# Altium schematic sheet Regulator_Sheet.SchDoc
size A4; DocumentNumber: 3; SheetNumber: 3; SheetTotal: 4
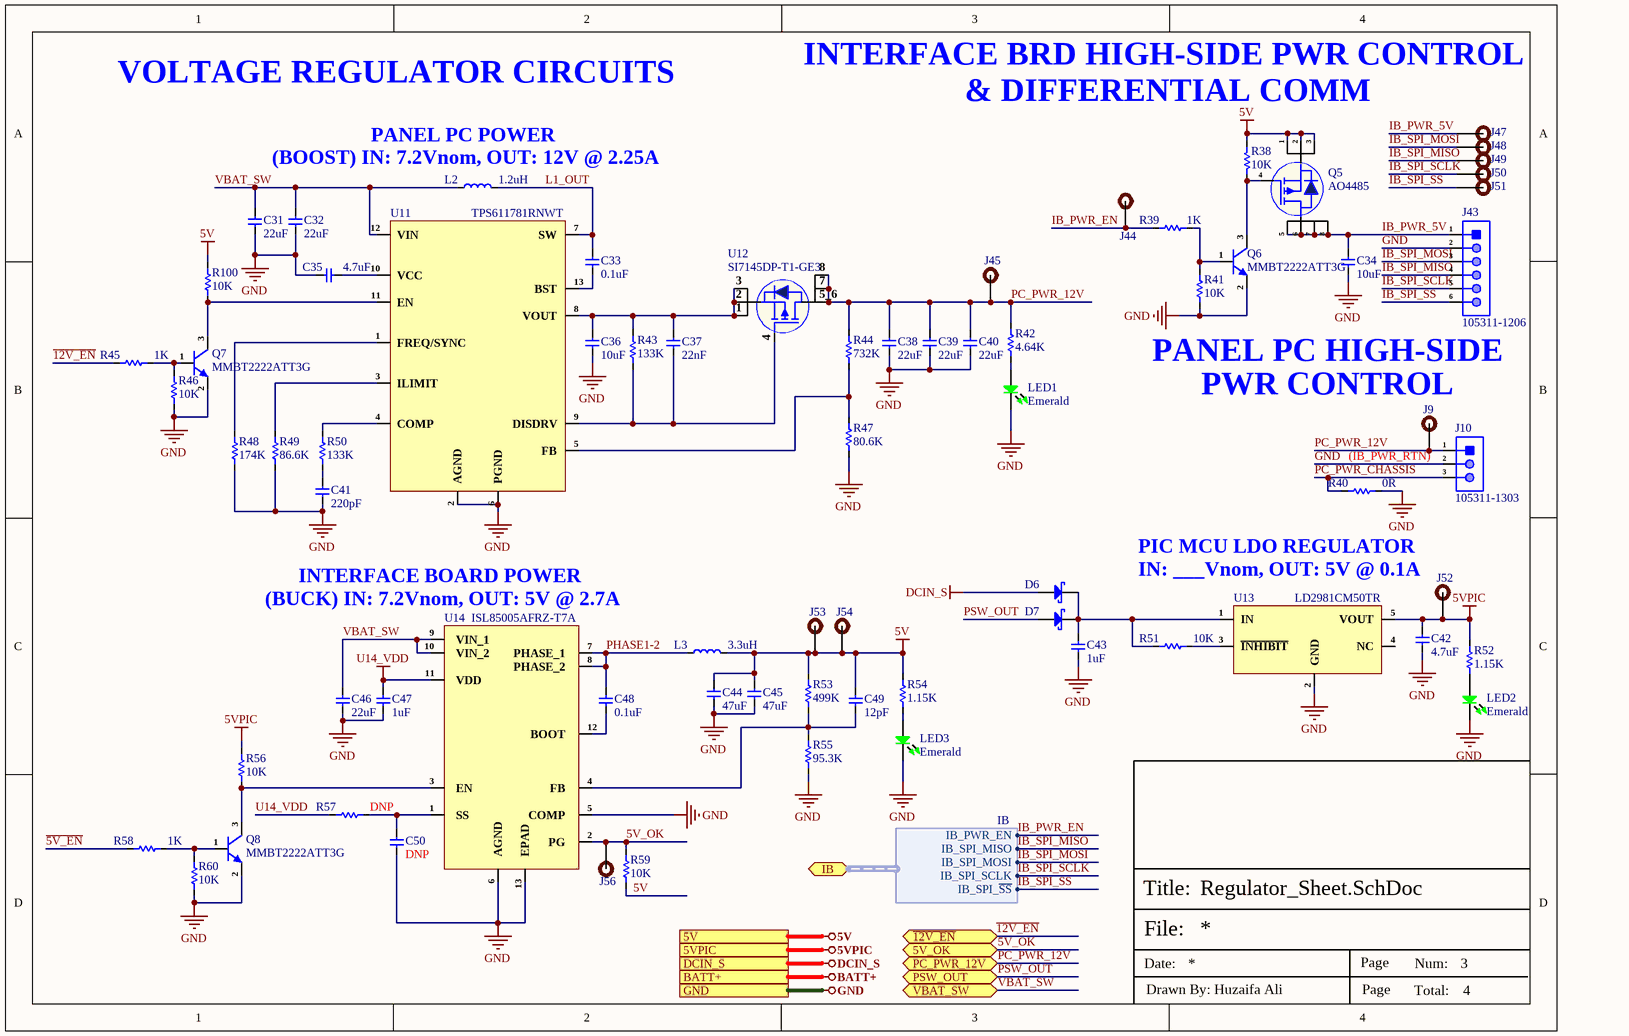
[diagram p0: Regulator_Sheet.SchDoc]

## Parts
C31  22uF  [Cap-1206]
C32  22uF  [Cap-1206]
C33  0.1uF  [Cap-0603]
C34  10uF  [Cap-0603]
C35  4.7uF  [Cap-0603]
C36  10uF  [Cap-1206]
C37  22nF  [Cap-0603]
C38  22uF  [Cap-1206]
C39  22uF  [Cap-1206]
C40  22uF  [Cap-1206]
C41  220pF  [Cap-0603]
C42  4.7uF  [Cap-0603]
C43  1uF  [Cap-0603]
C44  47uF  [SMD 2 J_Lead]
C45  47uF  [SMD 2 J_Lead]
C46  22uF  [Cap-1206]
C47  1uF  [Cap-0603]
C48  0.1uF  [Cap-0402]
C49  12pF  [Cap-0402]
C50  DNP  [Cap-0402]
D6  1SS404,H3F  [USC]  (value not drawn)
D7  1SS404,H3F  [USC]  (value not drawn)
J9  Test Point -TH 1.8mm Hole size 0.92mm  [Test Point -TH 1.8mm Hole size 0.92mm]  (value not drawn)  (no BOM)
J10  105311-1303  [1053111303]
J43  105311-1206  [1053111206]
J44  Test Point -TH 1.8mm Hole size 0.92mm  [Test Point -TH 1.8mm Hole size 0.92mm]  (value not drawn)  (no BOM)
J45  Test Point -TH 1.8mm Hole size 0.92mm  [Test Point -TH 1.8mm Hole size 0.92mm]  (value not drawn)  (no BOM)
J47  Test Point -TH 1.8mm Hole size 0.92mm  [Test Point -TH 1.8mm Hole size 0.92mm]  (value not drawn)  (no BOM)
J48  Test Point -TH 1.8mm Hole size 0.92mm  [Test Point -TH 1.8mm Hole size 0.92mm]  (value not drawn)  (no BOM)
J49  Test Point -TH 1.8mm Hole size 0.92mm  [Test Point -TH 1.8mm Hole size 0.92mm]  (value not drawn)  (no BOM)
J50  Test Point -TH 1.8mm Hole size 0.92mm  [Test Point -TH 1.8mm Hole size 0.92mm]  (value not drawn)  (no BOM)
J51  Test Point -TH 1.8mm Hole size 0.92mm  [Test Point -TH 1.8mm Hole size 0.92mm]  (value not drawn)  (no BOM)
J52  Test Point -TH 1.8mm Hole size 0.92mm  [Test Point -TH 1.8mm Hole size 0.92mm]  (value not drawn)  (no BOM)
J53  Test Point -TH 1.8mm Hole size 0.92mm  [Test Point -TH 1.8mm Hole size 0.92mm]  (value not drawn)  (no BOM)
J54  Test Point -TH 1.8mm Hole size 0.92mm  [Test Point -TH 1.8mm Hole size 0.92mm]  (value not drawn)  (no BOM)
J56  Test Point -TH 1.8mm Hole size 0.92mm  [Test Point -TH 1.8mm Hole size 0.92mm]  (value not drawn)  (no BOM)
L2  1.2uH  [XAL5030-122MEC]
L3  3.3uH  [DRA74-3R3-R]
LED1  Emerald  [LED-0603]
LED2  Emerald  [LED-0603]
LED3  Emerald  [LED-0603]
Q5  AO4485  [SOIC-8]
Q6  MMBT2222ATT3G  [MMBT2222ATT3G]
Q7  MMBT2222ATT3G  [MMBT2222ATT3G]
Q8  MMBT2222ATT3G  [MMBT2222ATT3G]
R38  10K  [Res-0603]
R39  1K  [Res-0603]
R40  0R  [Res-0805]
R41  10K  [Res-0603]
R42  4.64K  [Res-1206]
R43  133K  [Res-0402]
R44  732K  [Res-0402]
R45  1K  [Res-0603]
R46  10K  [Res-0603]
R47  80.6K  [Res-0402]
R48  174K  [Res-0402]
R49  86.6K  [Res-0402]
R50  133K  [Res-0402]
R51  10K  [Res-0603]
R52  1.15K  [Res-0402]
R53  499K  [Res-0402]
R54  1.15K  [Res-0402]
R55  95.3K  [Res-0402]
R56  10K  [Res-0603]
R57  DNP  [Res-0402]
R58  1K  [Res-0603]
R59  10K  [Res-0603]
R60  10K  [Res-0603]
R100  10K  [Res-0603]
U11  TPS611781RNWT  [VQFN-13-HR(3x3.5)]
U12  SI7145DP-T1-GE3  [PowerPAK-SO-8]
U13  LD2981CM50TR  [SOT-23-5]
U14  ISL85005AFRZ-T7A  [12-DFN (4x3)]

## Ports
5V (see Controller_Sheet[4A]), 5V_OK (bidir, see Controller_Sheet[4A]), 5VPIC (see Controller_Sheet[4A]), BATT+ (see Power_Sheet[3D]), DCIN_S (see Controller_Sheet[4A], Power_Sheet[3D]), GND (see Controller_Sheet[4A], Power_Sheet[3D]), IB (bidir, harness IB, see Controller_Sheet[4B]), PC_PWR_12V (bidir, see Controller_Sheet[4A]), PSW_OUT (bidir, see Controller_Sheet[4A], Power_Sheet[2D]), VBAT_SW (bidir, see Power_Sheet[2D]), ~{12V_EN} (bidir, see Controller_Sheet[4A])

## Harnesses
IB: IB_PWR_EN, IB_SPI_MISO, IB_SPI_MOSI, IB_SPI_SCLK, IB_SPI_~{SS}

## Nets
5V: C44.2 C45.2 C49.2 J53.1 J54.1 L3.2 Q5.1(S) Q5.2(S) Q5.3(S) R38.2 R53.2 R54.2 R59.2 R100.1 ; port 5V
5VPIC: C42.2 J52.1 R52.2 R56.1 U13.5(VOUT) ; port 5VPIC
BATT+: port BATT+
DCIN_S: D6.2(A) ; port DCIN_S
GND: C31.1 C32.1 C34.1 C35.1 C36.1 C38.1 C39.1 C40.1 C41.1 C42.1 C43.1 C44.1 C45.1 C46.1 C47.1 C50.1 J10.2 J43.2 LED1.2 LED2.2 LED3.2 Q6.2(E) Q7.2(E) Q8.2(E) R40.1 R41.2 R46.2 R47.1 R48.1 R49.1 R55.2 R60.2 U11.2(AGND) U11.6(PGND) U13.2(GND) U14.5(COMP) U14.6(AGND) U14.13(EPAD) ; port GND
U14_VDD: C47.2 R57.1 U14.11(VDD)
~{12V_EN}: R45.1
~{5V_EN}: R58.1
5V_OK: J56.1 R59.1 U14.2(PG) ; port 5V_OK
IB_PWR_5V: C34.2 J43.1 J47.1 Q5.5(D) Q5.6(D) Q5.7(D) Q5.8(D)
IB_PWR_EN: J44.1 R39.1 ; port IB.IB_PWR_EN
IB_SPI_MISO: J43.4 J49.1 ; port IB.IB_SPI_MISO
IB_SPI_MOSI: J43.3 J48.1 ; port IB.IB_SPI_MOSI
IB_SPI_~{SS}: J43.6 J51.1 ; port IB.IB_SPI_~{SS}
IB_SPI_SCLK: J43.5 J50.1 ; port IB.IB_SPI_SCLK
L1_OUT: C33.2 L2.2 U11.7(SW)
PC_PWR_12V: C38.2 C39.2 C40.2 J9.1 J10.1 J45.1 R42.2 R44.2 U12.5_6(D) U12.7(D) U12.8(D) ; port PC_PWR_12V
PC_PWR_CHASSIS: J10.3 R40.2
PHASE1-2: C48.2 L3.1 U14.7(PHASE_1) U14.8(PHASE_2)
PSW_OUT: D7.2(A) ; port PSW_OUT
VBAT_SW: C31.2 C32.2 C46.2 L2.1 U11.12(VIN) U14.9(VIN_1) U14.10(VIN_2) ; port VBAT_SW
NetC33_1: C33.1 U11.13(BST)
NetC35_2: C35.2 U11.10(VCC)
NetC36_2: C36.2 C37.2 R43.2 U11.8(VOUT) U12.1(S) U12.2(S) U12.3(S)
NetC37_1: C37.1 R43.1 U11.9(DISDRV) U12.4(G)
NetC41_2: C41.2 R50.1
NetC43_2: C43.2 D6.1(K) D7.1(K) R51.1 U13.1(IN)
NetC48_1: C48.1 U14.12(BOOT)
NetC49_1: C49.1 R53.1 R55.1 U14.4(FB)
NetC50_2: C50.2 R57.2 U14.1(SS)
NetLED1_1: LED1.1 R42.1
NetLED2_1: LED2.1 R52.1
NetLED3_1: LED3.1 R54.1
NetQ5_4: Q5.4(G) Q6.3(C) R38.1
NetQ6_1: Q6.1(B) R39.2 R41.1
NetQ7_1: Q7.1(B) R45.2 R46.1
NetQ7_3: Q7.3(C) R100.2 U11.11(EN)
NetQ8_1: Q8.1(B) R58.2 R60.1
NetQ8_3: Q8.3(C) R56.2 U14.3(EN)
NetR44_1: R44.1 R47.2 U11.5(FB)
NetR48_2: R48.2 U11.1(FREQ/SYNC)
NetR49_2: R49.2 U11.3(ILIMIT)
NetR50_2: R50.2 U11.4(COMP)
NetR51_2: R51.2 U13.3(~{INHIBIT})

Not connected (* = marked no-connect by the designer): U13 4(NC)

## Notes on the sheet
- VOLTAGE REGULATOR CIRCUITS
- INTERFACE BRD HIGH-SIDE PWR CONTROL
  & DIFFERENTIAL COMM
- (near L2) PANEL PC POWER
  (BOOST) IN: 7.2Vnom, OUT: 12V @ 2.25A
- PANEL PC HIGH-SIDE
- (near J9) PWR CONTROL
- (IB_PWR_RTN)
- PIC MCU LDO REGULATOR
  IN: ___Vnom, OUT: 5V @ 0.1A
- INTERFACE BOARD POWER
  (BUCK) IN: 7.2Vnom, OUT: 5V @ 2.7A
- Labels drawn without touching a wire or pin: ~{12V_EN}
- File:
- Title:
- Date:
- Page
- Num:
- Total:
- Drawn By: Huzaifa Ali

## Library data of the parts
C31 C32 C38-C40 C46 = C3216X5R1E226MTJ00N: Multilayer Ceramic Capacitor, 22 uF, 25 V, ± 20%, X5R, 1206 [3216 Metric]; Manufacturer: TDK; Manufacturer Part Number: C3216X5R1E226M160AB; Material: 4241ConductorMaterial; Voltage Rating: 25V; Supplier: Digikey; Supplier Part Number: 445-6000-1-ND; RoHS: Yes; Category: Ceramic Capacitors; Stock: 21443; Pricing: 1=0.8, 10=0.557, 50=0.4692, 100=0.3821, 500=0.3184, 1000=0.26813 (USD); Mounting Technology: Surface Mount; Case/Package: 1206; Case Code (Metric): 3216; Case Code (Imperial): 1206; Weight: 0.000571oz; Dielectric Material: 4241ConductorMaterial; Min Operating Temperature: -55°C; Max Operating Temperature: 85°C; Package Quantity: 1; Value: 22uF; Tolerance: 20%; Packaging: Tape and Reel; Voltage Rating (DC): 25V; Dielectric: X5R; Termination: SMD/SMT; Series: C; Construction: Flat; Length: 3.2mm; Width: 0.063inch; Height: 1.6mm; Thickness: 0.071inch; Depth: 1.6mm; RoHS Compliant: Yes; Reach SVHC Compliant: Unknown; Lead Free: 5697LeadFree; ComponentLink1URL: https://datasheet.ciiva.com/24216/c3216x5r1e226m160ab-265194-24216564.pdf?src-supplier=Mouser; ComponentLink1Description: https://datasheet.ciiva.com/24216/c3216x5r1e226m160ab-265194-24216564.pdf?src-supplier=Mouser; ComponentLink2URL: https://datasheet.ciiva.com/6285/tdkmlcccaprange-6285575.pdf?src-supplier=Digikey; ComponentLink2Description: https://datasheet.ciiva.com/6285/tdkmlcccaprange-6285575.pdf?src-supplier=Digikey; ComponentLink3URL: https://datasheet.ciiva.com/6285/tdkmlcccaprange-6285573.pdf?src-supplier=Digikey; ComponentLink3Description: https://datasheet.ciiva.com/6285/tdkmlcccaprange-6285573.pdf?src-supplier=Digikey
C33 = CL10B104KB8NNNC: CAP CER 0.1UF 50V X7R 0603; Manufacturer: Samsung; Material: Ceramic; Capacitance: 100nF; Tolerance: 10%; Supplier 1: Digi-Key; Manufacturer Part Number: CL10B104KB8NNNC; RoHS: Yes; Category: Ceramic Capacitors; Stock 1: 3998791; Pricing 1: 1=0.10000, 10=0.03000, 50=0.01640, 100=0.01340, 500=0.00954, 1000=0.00750 (USD); Mount: Surface Mount; Case/Package: 0603; Case Code (Metric): 1608; Case Code (Imperial): 0603; Contact Plating: Tin; Min Operating Temperature: -55°C; Max Operating Temperature: 125°C; Dielectric: X7R; Voltage Rating: 50V; Package Quantity: 1; Packaging: Tape and Reel; Voltage: 50V; Voltage Rating (DC): 50V; Series: CL; Construction: Flat; Length: 1.6mm; Width: 0.031inch; Height: 0.8mm; Depth: 0.8mm; Thickness: 0.035inch; Radiation Hardening: No; Lead Free: Lead Free; RoHS Compliant: Yes; ComponentLink1URL: https://datasheet.ciiva.com/25803/cl10b104kb8nnnc-25803393.pdf?src-supplier=Digi-Key; ComponentLink1Description: https://datasheet.ciiva.com/25803/cl10b104kb8nnnc-25803393.pdf?src-supplier=Digi-Key; ComponentLink2URL: https://datasheet.ciiva.com/26838/getdatasheetpartid-89097-26838411.pdf?src-supplier=Verical; ComponentLink2Description: https://datasheet.ciiva.com/26838/getdatasheetpartid-89097-26838411.pdf?src-supplier=Verical; ComponentLink3URL: https://datasheet.ciiva.com/29198/456651-da-01-en-vs-kondensator-0605-29198839.pdf?src-supplier=Conrad; ComponentLink3Description: https://datasheet.ciiva.com/29198/456651-da-01-en-vs-kondensator-0605-29198839.pdf?src-supplier=Conrad; Supplier Part Number 1: 1276-1000-1-ND; LCSC Part Number: C1591
C34 = CC0603KRX5R6BB106: CAP CER 10UF 10V X5R 0603; Manufacturer: Yageo; Tolerance: 10%; Item Type: Capacitor; Supplier 1: Digi-Key; Manufacturer Part Number: CC0603KRX5R6BB106; RoHS: Yes; Category: Ceramic Capacitors; Stock 1: 187515; Pricing 1: 1=0.24000, 10=0.16300, 50=0.09780, 100=0.08260, 500=0.05654, 1000=0.05001 (USD); Mount: Surface Mount; Case/Package: 0603; Case Code (Metric): 1608; Case Code (Imperial): 0603; Weight: 7.1E-05oz; Min Operating Temperature: -55°C; Max Operating Temperature: 85°C; Capacitance: 10uF; Packaging: Tape and Reel; Dielectric: X5R; Voltage Rating: 10V; Termination: SMD/SMT; Resistor Type: Ceramic; Voltage Rating (DC): 10V; Package Quantity: 4000; Length: 0.063inch; Width: 0.031inch; Thickness: 0.035inch; Depth: 0.8mm; Lead Free: Lead Free; Halogen Free: Halogen Free; RoHS Compliant: Yes; ComponentLink1URL: http://www.mouser.com/ds/2/447/Yageo_UPY-GP_NP0_16V-to-50V_9-358835.pdf?src-supplier=Mouser; ComponentLink1Description: http://www.mouser.com/ds/2/447/Yageo_UPY-GP_NP0_16V-to-50V_9-358835.pdf?src-supplier=Mouser; ComponentLink2URL: http://www.yageo.com/documents/recent/UPY-GPHC_X5R_4V-to-50V_25.pdf?src-supplier=Digi-Key; ComponentLink2Description: http://www.yageo.com/documents/recent/UPY-GPHC_X5R_4V-to-50V_25.pdf?src-supplier=Digi-Key; Supplier Part Number 1: 311-1782-1-ND; LCSC Part Number: C326057
C35 C42 = CC0603KRX5R7BB475: CAP CER 4.7UF 16V X5R 0603; Manufacturer: Yageo; Tolerance: 10%; Item Type: Capacitor; Supplier 1: Digi-Key; Manufacturer Part Number: CC0603KRX5R7BB475; RoHS: Yes; Category: Ceramic Capacitors; Stock 1: 547703; Pricing 1: 1=0.20000, 10=0.13800, 50=0.08280, 100=0.06990, 500=0.04784, 1000=0.04233 (USD); Mount: Surface Mount; Case/Package: 0603; Case Code (Imperial): 0603; Case Code (Metric): 1608; Weight: 7.1E-05oz; Min Operating Temperature: -55°C; Max Operating Temperature: 85°C; Capacitance: 4.7uF; Voltage Rating: 16V; Voltage Rating (DC): 16V; Packaging: Tape and Reel; Dielectric: X5R; Termination: SMD/SMT; Resistor Type: Ceramic; Series: CC; Length: 1.6mm; Width: 0.8mm; Height: 0.8mm; Thickness: 0.037inch; Depth: 0.8mm; Lead Free: Lead Free; Halogen Free: Halogen Free; RoHS Compliant: Yes; ComponentLink1URL: http://www.mouser.com/ds/2/447/UPY-GPHC_X5R_4V-to-50V_25-1131599.pdf?src-supplier=Mouser; ComponentLink1Description: http://www.mouser.com/ds/2/447/UPY-GPHC_X5R_4V-to-50V_25-1131599.pdf?src-supplier=Mouser; ComponentLink2URL: http://www.yageo.com/documents/recent/UPY-GPHC_X5R_4V-to-50V_25.pdf?src-supplier=Digi-Key; ComponentLink2Description: http://www.yageo.com/documents/recent/UPY-GPHC_X5R_4V-to-50V_25.pdf?src-supplier=Digi-Key; Supplier Part Number 1: 311-1785-1-ND; LCSC Part Number: C277476
C36 = CC1206KKX5R9BB106: CAP CER 10UF 50V X5R 1206; Manufacturer: Yageo; Item Type: Capacitors; Material: 4241ConductorMaterial; Tolerance: 10%; Supplier: Future Electronics; Supplier Part Number: 2072123; Manufacturer Part Number: CC1206KKX5R9BB106; RoHS: Yes; Stock: 220000; Pricing: 2000=0.0907, 6000=0.0872, 10000=0.0856, 30000=0.0823, 50000=0.0795 (USD); Mounting Technology: Surface Mount; Case/Package: 1206; Case Code (Imperial): 1206; Case Code (Metric): 3216; Min Operating Temperature: -55°C; Max Operating Temperature: 85°C; Packaging: Cut Tape; Value: 10uF; Voltage Rating: 50V; Voltage Rating (DC): 50V; Dielectric: X5R; Series: CC; Length: 0.126inch; Width: 0.063inch; Height: 1.9mm; Thickness: 0.075inch; Lead Free: Lead Free; Halogen Free: Halogen Free; RoHS Compliant: Yes; ComponentLink1URL: https://datasheet.octopart.com/CC1206KKX5R9BB106-Yageo-datasheet-170350636.pdf?src-supplier=Future+Electronics; ComponentLink1Description: https://datasheet.octopart.com/CC1206KKX5R9BB106-Yageo-datasheet-170350636.pdf?src-supplier=Future+Electronics; ComponentLink2URL: https://datasheet.octopart.com/CC1206KKX5R9BB106-Yageo-datasheet-145016144.pdf?src-supplier=Future+Electronics; ComponentLink2Description: https://datasheet.octopart.com/CC1206KKX5R9BB106-Yageo-datasheet-145016144.pdf?src-supplier=Future+Electronics; ComponentLink3URL: http://www.yageo.com/documents/recent/UPY-GPHC_X5R_4V-to-50V_25.pdf?src-supplier=Digikey; ComponentLink3Description: http://www.yageo.com/documents/recent/UPY-GPHC_X5R_4V-to-50V_25.pdf?src-supplier=Digikey; LCSC Part Number: C100122
C37 = CC0603KRX7R9BB223: CAP CER 0.022UF 50V X7R 0603; Manufacturer: Yageo; Dielectric Material: Ceramic; Tolerance: 10%; Insulation Resistance: 100GR; Item Type: Capacitor; Supplier 1: Digi-Key; Manufacturer Part Number: CC0603KRX7R9BB223; RoHS: Yes; Category: Ceramic Capacitors; Stock 1: 119735; Pricing 1: 1=0.10000, 10=0.05500, 50=0.03020, 100=0.02460, 500=0.01760, 1000=0.01383 (USD); Mount: Surface Mount; Case/Package: 0603; Number of Pins: 2; Case Code (Metric): 1608; Case Code (Imperial): 0603; Min Operating Temperature: -55°C; Max Operating Temperature: 125°C; Capacitance: 22nF; Dielectric: X7R; Voltage: 50V; Package Quantity: 1; Voltage Rating: 50V; Packaging: Tape and Reel; Voltage Rating (DC): 50V; Termination: SMD/SMT; Resistor Type: Ceramic; Series: CC; Length: 1.6mm; Width: 0.031inch; Height: 0.8mm; Depth: 0.8mm; Thickness: 0.035inch; Radiation Hardening: No; RoHS Compliant: Yes; REACH SVHC: No SVHC; Lead Free: Lead Free; Halogen Free: Halogen Free; ComponentLink1URL: https://datasheet.ciiva.com/8033/70765-8033869.pdf?src-supplier=Element14; ComponentLink1Description: https://datasheet.ciiva.com/8033/70765-8033869.pdf?src-supplier=Element14; ComponentLink2URL: https://datasheet.ciiva.com/28450/1489800-28450639.pdf?src-supplier=Element14; ComponentLink2Description: https://datasheet.ciiva.com/28450/1489800-28450639.pdf?src-supplier=Element14; ComponentLink3URL: https://datasheet.ciiva.com/8033/1489800-8033867.pdf?src-supplier=Element14; ComponentLink3Description: https://datasheet.ciiva.com/8033/1489800-8033867.pdf?src-supplier=Element14; ComponentLink4URL: https://datasheet.ciiva.com/8033/1489800-8033865.pdf?src-supplier=Element14; ComponentLink4Description: https://datasheet.ciiva.com/8033/1489800-8033865.pdf?src-supplier=Element14; ComponentLink5URL: https://datasheet.ciiva.com/156/mlccorderingcode-156178.pdf?src-supplier=Digi-Key; ComponentLink5Description: https://datasheet.ciiva.com/156/mlccorderingcode-156178.pdf?src-supplier=Digi-Key; ComponentLink6URL: https://datasheet.ciiva.com/156/mlccorderingcode-156177.pdf?src-supplier=Digi-Key; ComponentLink6Description: https://datasheet.ciiva.com/156/mlccorderingcode-156177.pdf?src-supplier=Digi-Key; ComponentLink7URL: https://datasheet.ciiva.com/156/mlccorderingcode-156179.pdf?src-supplier=Digi-Key; ComponentLink7Description: https://datasheet.ciiva.com/156/mlccorderingcode-156179.pdf?src-supplier=Digi-Key; ComponentLink8URL: https://datasheet.ciiva.com/11464/upy-gphc-x7r-6-3v-to-50v-8-11464741.pdf?src-supplier=Avnet; ComponentLink8Description: https://datasheet.ciiva.com/11464/upy-gphc-x7r-6-3v-to-50v-8-11464741.pdf?src-supplier=Avnet; Supplier Part Number 1: 311-1370-1-ND; LCSC Part Number: C106222
C41 = CS1608X7R221K500NRB: 50V 220pF X7R ±10% 0603 Multilayer Ceramic Capacitors MLCC - SMD/SMT ROHS; Manufacturer: Samwha Capacitors; Manufacturer Part Number: CS1608X7R221K500NRB; Package: 0603; LCSC Part Number: C5255295; Item Type: Capacitor; ComponentLink1Description: LCSC; ComponentLink1URL: https://www.lcsc.com/product-detail/Multilayer-Ceramic-Capacitors-MLCC-SMD-SMT_Samwha-Capacitor-CS1608X7R221K500NRB_C5255295.html
C43 C47 = CC0603KRX5R8BB105: CAP CER 1UF 25V X5R 0603; Manufacturer: Yageo; Tolerance: 10%; Item Type: Capacitor; Supplier 1: Digi-Key; Manufacturer Part Number: CC0603KRX5R8BB105; RoHS: Yes; Category: Ceramic Capacitors; Stock 1: 919939; Pricing 1: 1=0.12000, 10=0.08400, 50=0.04760, 100=0.03940, 500=0.02764, 1000=0.02288 (USD); Mount: Surface Mount; Case/Package: 0603; Number of Pins: 2; Case Code (Metric): 1608; Case Code (Imperial): 0603; Min Operating Temperature: -55°C; Max Operating Temperature: 85°C; Capacitance: 1uF; Dielectric: X5R; Package Quantity: 1; Voltage Rating: 25V; Packaging: Tape and Reel; Termination: SMD/SMT; Voltage Rating (DC): 25V; Series: CC; Construction: Flat; Length: 1.6mm; Width: 0.031inch; Height: 0.8mm; Thickness: 0.035inch; Depth: 0.8mm; Radiation Hardening: No; REACH SVHC: No SVHC; Lead Free: Lead Free; Halogen Free: Halogen Free; RoHS Compliant: Yes; ComponentLink1URL: https://datasheet.ciiva.com/176/mlccorderingcode-176785.pdf?src-supplier=Digi-Key; ComponentLink1Description: https://datasheet.ciiva.com/176/mlccorderingcode-176785.pdf?src-supplier=Digi-Key; ComponentLink2URL: https://datasheet.ciiva.com/176/mlccorderingcode-176786.pdf?src-supplier=Digi-Key; ComponentLink2Description: https://datasheet.ciiva.com/176/mlccorderingcode-176786.pdf?src-supplier=Digi-Key; ComponentLink3URL: https://datasheet.ciiva.com/176/mlccorderingcode-176787.pdf?src-supplier=Digi-Key; ComponentLink3Description: https://datasheet.ciiva.com/176/mlccorderingcode-176787.pdf?src-supplier=Digi-Key; ComponentLink4URL: https://datasheet.ciiva.com/17436/upy-gphc-x5r-4v-to-50v-12-17436952.pdf?src-supplier=Avnet+Europe; ComponentLink4Description: https://datasheet.ciiva.com/17436/upy-gphc-x5r-4v-to-50v-12-17436952.pdf?src-supplier=Avnet+Europe; ComponentLink5URL: https://datasheet.ciiva.com/7978/1525783-7978171.pdf?src-supplier=Element14; ComponentLink5Description: https://datasheet.ciiva.com/7978/1525783-7978171.pdf?src-supplier=Element14; ComponentLink6URL: https://datasheet.ciiva.com/11586/upy-gphc-x5r-4v-to-50v-12-11586318.pdf?src-supplier=Avnet; ComponentLink6Description: https://datasheet.ciiva.com/11586/upy-gphc-x5r-4v-to-50v-12-11586318.pdf?src-supplier=Avnet; Supplier Part Number 1: 311-1445-1-ND; LCSC Part Number: C14664
C44 C45 = CKG57NX7R1H476M500JH: CAP CER 47UF 50V X7R 2SMD; Manufacturer: TDK; Item Type: Capacitor; Material: 4241ConductorMaterial; Tolerance: 20%; Supplier: Digikey; Supplier Part Number: 445-CKG57NX7R1H476M500JHCT-ND; Manufacturer Part Number: CKG57NX7R1H476M500JH; RoHS: No; Stock: 2307; Pricing: 1=8.39, 10=7.269, 50=6.5232, 100=5.6659, 500=5.1254 (USD); Min Operating Temperature: -55°C; Max Operating Temperature: 125°C; Value: 47uF; Voltage Rating: 50V; Length: 6mm; Width: 5mm; Height: 5.5mm; ComponentLink1URL: https://datasheet.octopart.com/CKG57NX7R1H476M500JH-TDK-datasheet-151704564.pdf?src-supplier=Farnell; ComponentLink1Description: https://datasheet.octopart.com/CKG57NX7R1H476M500JH-TDK-datasheet-151704564.pdf?src-supplier=Farnell
C48 = GRM155R71C104KA88D: CAP CER 0.1UF 16V X7R 0402; Manufacturer: Murata; Material: Ceramic; Value: 100nF; Tolerance: 10%; Insulation Resistance: 10GR; Item Type: Capacitor; Supplier 1: Arrow Electronics; Manufacturer Part Number: GRM155R71C104KA88D; RoHS: Yes; Category: Ceramic Capacitors; Stock 1: 1690322; Pricing 1: 10000=0.00480, 30000=0.00470, 100000=0.00350, 250000=0.00330 (USD); Mounting Technology: Surface Mount; Case/Package: 0402; Pins: 2; Case Code (Metric): 1005; Case Code (Imperial): 0402; Dielectric Material: Ceramic; Min Operating Temperature: -55°C; Max Operating Temperature: 125°C; Voltage Rating: 16V; Packaging: Tape and Reel; Voltage Rating (DC): 16V; Package Quantity: 1; Dielectric: X7R; Termination: SMD/SMT; Voltage: 16V; Series: GRM; Length: 1mm; Width: 0.02inch; Height: 0.5mm; Thickness: 0.022inch; Depth: 0.5mm; Radiation Hardening: No; Lead Free: Lead Free; RoHS Compliant: Yes; ComponentLink1URL: https://datasheet.ciiva.com/129/grm155r71c104ka88-01-129739.pdf?src-supplier=Digi-Key; ComponentLink1Description: https://datasheet.ciiva.com/129/grm155r71c104ka88-01-129739.pdf?src-supplier=Digi-Key; ComponentLink2URL: https://datasheet.ciiva.com/129/grm155r71c104ka88-01-129740.pdf?src-supplier=Digi-Key; ComponentLink2Description: https://datasheet.ciiva.com/129/grm155r71c104ka88-01-129740.pdf?src-supplier=Digi-Key; ComponentLink3URL: https://datasheet.ciiva.com/18102/getdatasheetpartid-85307-18102905.pdf?src-supplier=Verical; ComponentLink3Description: https://datasheet.ciiva.com/18102/getdatasheetpartid-85307-18102905.pdf?src-supplier=Verical; ComponentLink4URL: https://datasheet.ciiva.com/29199/454098-da-01-en-vs-kondensator-0402-29199799.pdf?src-supplier=Conrad; ComponentLink4Description: https://datasheet.ciiva.com/29199/454098-da-01-en-vs-kondensator-0402-29199799.pdf?src-supplier=Conrad; ComponentLink5URL: https://datasheet.ciiva.com/7937/4360-7937615.pdf?src-supplier=Element14; ComponentLink5Description: https://datasheet.ciiva.com/7937/4360-7937615.pdf?src-supplier=Element14; ComponentLink6URL: https://datasheet.ciiva.com/14116/grmseries-highdielectrictype-eng-14116878.pdf?src-supplier=Distrelec; ComponentLink6Description: https://datasheet.ciiva.com/14116/grmseries-highdielectrictype-eng-14116878.pdf?src-supplier=Distrelec; ComponentLink7URL: https://datasheet.ciiva.com/14103/grmseries-highdielectrictype-eng-14103750.pdf?src-supplier=Distrelec; ComponentLink7Description: https://datasheet.ciiva.com/14103/grmseries-highdielectrictype-eng-14103750.pdf?src-supplier=Distrelec; ComponentLink8URL: https://datasheet.ciiva.com/28534/4360-28534127.pdf?src-supplier=Element14; ComponentLink8Description: https://datasheet.ciiva.com/28534/4360-28534127.pdf?src-supplier=Element14; ComponentLink9URL: https://datasheet.ciiva.com/28534/4360-28534133.pdf?src-supplier=Element14; ComponentLink9Description: https://datasheet.ciiva.com/28534/4360-28534133.pdf?src-supplier=Element14; ComponentLink10URL: https://datasheet.ciiva.com/16199/product-16199000.pdf?src-supplier=Future+Electronics; ComponentLink10Description: https://datasheet.ciiva.com/16199/product-16199000.pdf?src-supplier=Future+Electronics; Supplier Part Number 1: GRM155R71C104KA88D; LCSC Part Number: C71629
C49 = GJM1555C1H120GB01D: CAP CER 12PF 50V C0G/NP0 0402; Manufacturer: Murata; Tolerance: 2%; Dielectric: C0G; Supplier 1: Digi-Key; Manufacturer Part Number: GJM1555C1H120GB01D; RoHS: Yes; Category: Ceramic Capacitors; Stock 1: 266975; Pricing 1: 1=0.18000, 10=0.12600, 50=0.07560, 100=0.06390, 500=0.04370, 1000=0.03865, 2500=0.03698, 5000=0.03361 (USD); Mount: Surface Mount; Case/Package: 0402; Case Code (Imperial): 0402; Case Code (Metric): 1005; Min Operating Temperature: -55°C; Max Operating Temperature: 125°C; Capacitance: 12pF; Voltage Rating: 50V; Voltage Rating (DC): 50V; Packaging: Tape and Reel; Package Quantity: 10000; Termination: SMD/SMT; Series: GJM; Construction: Flat; Length: 1mm; Width: 0.5mm; Height: 0.5mm; Thickness: 0.022inch; Depth: 0.5mm; Radiation Hardening: No; Lead Free: Lead Free; RoHS Compliant: Yes; ComponentLink1URL: https://datasheet.ciiva.com/11608/product-11608208.pdf?src-supplier=Avnet; ComponentLink1Description: https://datasheet.ciiva.com/11608/product-11608208.pdf?src-supplier=Avnet; ComponentLink2URL: https://datasheet.ciiva.com/29542/partnumbering-e-01-29542716.pdf?src-supplier=Digi-Key; ComponentLink2Description: https://datasheet.ciiva.com/29542/partnumbering-e-01-29542716.pdf?src-supplier=Digi-Key; ComponentLink3URL: https://datasheet.ciiva.com/29542/partnumbering-e-01-29542715.pdf?src-supplier=Digi-Key; ComponentLink3Description: https://datasheet.ciiva.com/29542/partnumbering-e-01-29542715.pdf?src-supplier=Digi-Key; ComponentLink4URL: https://datasheet.ciiva.com/29542/partnumbering-e-01-29542717.pdf?src-supplier=Digi-Key; ComponentLink4Description: https://datasheet.ciiva.com/29542/partnumbering-e-01-29542717.pdf?src-supplier=Digi-Key; Supplier Part Number 1: 490-8078-1-ND; LCSC Part Number: C161305
C50 = GRM155R71C104KA88D: ComponentLink6URL: https://datasheet.ciiva.com/14116/grmseries-highdielectrictype-eng-14116878.pdf?src-supplier=Distrelec; ComponentLink6Description: https://datasheet.ciiva.com/14116/grmseries-highdielectrictype-eng-14116878.pdf?src-supplier=Distrelec; ComponentLink7URL: https://datasheet.ciiva.com/14103/grmseries-highdielectrictype-eng-14103750.pdf?src-supplier=Distrelec; ComponentLink7Description: https://datasheet.ciiva.com/14103/grmseries-highdielectrictype-eng-14103750.pdf?src-supplier=Distrelec; ComponentLink8URL: https://datasheet.ciiva.com/28534/4360-28534127.pdf?src-supplier=Element14; ComponentLink8Description: https://datasheet.ciiva.com/28534/4360-28534127.pdf?src-supplier=Element14; ComponentLink9URL: https://datasheet.ciiva.com/28534/4360-28534133.pdf?src-supplier=Element14; ComponentLink9Description: https://datasheet.ciiva.com/28534/4360-28534133.pdf?src-supplier=Element14; ComponentLink10URL: https://datasheet.ciiva.com/16199/product-16199000.pdf?src-supplier=Future+Electronics; ComponentLink10Description: https://datasheet.ciiva.com/16199/product-16199000.pdf?src-supplier=Future+Electronics
D6 D7 = 1SS404,H3F: Diode Schottky Barrier 25V 0.3A 2 SOD-323; Manufacturer: Toshiba; Average Rectified Current: 300mA; Max Reverse Voltage (DC): 20V; Supplier 1: Avnet; Manufacturer Part Number: 1SS404,H3F; RoHS: No; Category: Rectifier Diodes; Stock 1: 36000; Pricing 1: 3000=0.01778, 6000=0.01748, 12000=0.01718, 18000=0.01688, 24000=0.01658 (USD); Mount: Surface Mount; Case/Package: SOD; Contact Plating: Tin,Silver; Min Operating Temperature: -40°C; Max Operating Temperature: 100°C; Packaging: Cut Tape; Forward Current: 300mA; Max Repetitive Reverse Voltage (Vrrm): 25V; Series: -; ComponentLink1URL: https://datasheet.ciiva.com/45259/dst-1ss404-tde-en-1850-45259189.pdf?src-supplier=Digikey; ComponentLink1Description: https://datasheet.ciiva.com/45259/dst-1ss404-tde-en-1850-45259189.pdf?src-supplier=Digikey; ComponentLink2URL: https://datasheet.ciiva.com/45259/dst-1ss404-tde-en-1850-45259190.pdf?src-supplier=Digikey; ComponentLink2Description: https://datasheet.ciiva.com/45259/dst-1ss404-tde-en-1850-45259190.pdf?src-supplier=Digikey; ComponentLink3URL: https://datasheet.ciiva.com/45259/dst-1ss404-tde-en-1850-45259191.pdf?src-supplier=Digikey; ComponentLink3Description: https://datasheet.ciiva.com/45259/dst-1ss404-tde-en-1850-45259191.pdf?src-supplier=Digikey; Supplier Part Number 1: 1SS404,H3F; Item Type: Diode; LCSC Part Number: C146358
J10 = 105311-1303: CONN HEADER VERT 3POS 2.5MM; Manufacturer: Molex; Number of Positions: 3; Voltage Rating: 250V; Supplier: Mouser; Supplier Part Number: 538-105311-1303; Manufacturer Part Number: 105311-1303; RoHS: No; Item Type: Header; Stock: 668; Pricing: 1=1.61, 10=1.35, 50=1.35, 100=1.12, 1000=0.918, 10000=0.796 (USD); Mounting Technology: Through Hole; Contact Material: Brass; Contact Shape: Square; Insulation Material: Polymer; Insulation Color: Black; Contact Finish - Mating: GOLD; Min Operating Temperature: -40°C; Max Operating Temperature: 105°C; Number of Rows: 1; Connector Type: Header; Fastening Type: Latch; Packaging: Tray; Termination: Solder; Series: Nano-Fit 105311; Contact Type: Male Pin; ComponentLink1URL: https://www.molex.com/pdm_docs/sd/1053111102_sd.pdf?src-supplier=Digikey; ComponentLink1Description: https://www.molex.com/pdm_docs/sd/1053111102_sd.pdf?src-supplier=Digikey
J43 = 105311-1206: CONN HEADER VERT 6POS 2.5MM; Manufacturer: Molex; Supplier: Mouser; Supplier Part Number: 538-105311-1206; Manufacturer Part Number: 105311-1206; RoHS: No; Item Type: Header; Stock: 291; Pricing: 1=2.1, 10=1.48, 50=1.48, 100=1.48, 1000=1.17, 10000=1.17 (USD); ComponentLink1URL: https://www.molex.com/pdm_docs/sd/1053111102_sd.pdf?src-supplier=Digikey; ComponentLink1Description: https://www.molex.com/pdm_docs/sd/1053111102_sd.pdf?src-supplier=Digikey
L2 = XAL5030-122MEC: FIXED IND 1.2UH 10.4A 12.4MOHM; Manufacturer: Coilcraft; Item Type: Inductors; Core Material: Composite; Self Resonant Frequency: 61MHz; Tolerance: 20%; Shielding: Shielded; Max DC Current: 11.1A; Test Frequency: 100kHz; Saturation Current: 12.5A; Supplier: Mouser; Supplier Part Number: 994-XAL5030-122MEC; Manufacturer Part Number: XAL5030-122MEC; RoHS: Yes; Stock: 945; Pricing: 1=2.88, 10=2.88, 50=2.88, 100=2.88, 1000=1.31, 10000=1.31 (USD); Case/Package: SMD/SMT; Min Operating Temperature: -40°C; Max Operating Temperature: 125°C; Packaging: Tape and Reel; Value: 1.2uH; Termination: SMD/SMT; Series: XAL5030; Inductance Tolerance: 20%; RMS Current (Irms): 11.1A; Length: 5.68mm; Width: 5.48mm; Height: 3.1mm; Lead Free: Contains Lead; RoHS Compliant: Yes; Reach SVHC Compliant: Unknown; ComponentLink1URL: https://datasheet.ciiva.com/22680/1681990-22680352.pdf?src-supplier=Element14; ComponentLink1Description: https://datasheet.ciiva.com/22680/1681990-22680352.pdf?src-supplier=Element14; ComponentLink2URL: https://datasheet.ciiva.com/13277/xal50xx-13277233.pdf?src-supplier=Mouser; ComponentLink2Description: https://datasheet.ciiva.com/13277/xal50xx-13277233.pdf?src-supplier=Mouser; ComponentLink3URL: https://datasheet.ciiva.com/22760/1681990-22760013.pdf?src-supplier=Farnell; ComponentLink3Description: https://datasheet.ciiva.com/22760/1681990-22760013.pdf?src-supplier=Farnell; ComponentLink4URL: https://datasheet.ciiva.com/22701/1681990-22701564.pdf?src-supplier=Element14; ComponentLink4Description: https://datasheet.ciiva.com/22701/1681990-22701564.pdf?src-supplier=Element14
L3 = DRA74-3R3-R: FIXED IND 3.3UH 4.16A 16MOHM SMD; Manufacturer: Eaton Cooper; Item Type: Inductors; Supplier 1: Digikey; Manufacturer Part Number: DRA74-3R3-R; RoHS: Yes; Stock 1: 19552; Pricing 1: 1=1.64, 10=1.385, 25=1.2588, 50=1.1834, 100=0.9819, 250=0.90636, 500=0.85602 (USD); Lead Free: 5697LeadFree; ComponentLink1URL: https://datasheet.ciiva.com/6690/9190a0eb-f996-4faf-a4d6-7b76f954f32d-6690234.pdf?src-supplier=Digikey; ComponentLink1Description: https://datasheet.ciiva.com/6690/9190a0eb-f996-4faf-a4d6-7b76f954f32d-6690234.pdf?src-supplier=Digikey; ComponentLink2URL: https://datasheet.ciiva.com/6690/9190a0eb-f996-4faf-a4d6-7b76f954f32d-6690235.pdf?src-supplier=Digikey; ComponentLink2Description: https://datasheet.ciiva.com/6690/9190a0eb-f996-4faf-a4d6-7b76f954f32d-6690235.pdf?src-supplier=Digikey; ComponentLink3URL: https://datasheet.ciiva.com/6690/9190a0eb-f996-4faf-a4d6-7b76f954f32d-6690236.pdf?src-supplier=Digikey; ComponentLink3Description: https://datasheet.ciiva.com/6690/9190a0eb-f996-4faf-a4d6-7b76f954f32d-6690236.pdf?src-supplier=Digikey; ComponentLink4URL: https://datasheet.ciiva.com/16433/9190a0eb-f996-4faf-a4d6-7b76f954f32d-16433947.pdf?src-supplier=Future+Electronics; ComponentLink4Description: https://datasheet.ciiva.com/16433/9190a0eb-f996-4faf-a4d6-7b76f954f32d-16433947.pdf?src-supplier=Future+Electronics; Supplier Part Number 1: 283-3635-1-ND; LCSC Part Number: C3222421
LED1-LED3 = NCD0603G2: Emerald 0603 Light Emitting Diodes (LED) ROHS; Manufacturer: Foshan NationStar Optoelectronics; Manufacturer Part Number: NCD0603G2; Package: 0603; LCSC Part Number: C87326; Item Type: LED; ComponentLink1Description: LCSC; ComponentLink1URL: https://www.lcsc.com/product-detail/Light-Emitting-Diodes-LED_Foshan-NationStar-Optoelectronics-NCD0603G2_C87326.html
Q5 = AO4485: MOSFET P-CH 40V 10A 8SOIC; Manufacturer: Alpha & Omega Semiconductor; Item Type: MOSFETs; Supplier: Digikey; LCSC Part Number: C51499; Manufacturer Part Number: AO4485; RoHS: Yes; Stock: 22089; Pricing: 1=0.89, 10=0.768, 100=0.5318, 500=0.44432, 1000=0.37814 (USD); ComponentLink1URL: https://datasheet.ciiva.com/26861/getdatasheetpartid-417133-26861485.pdf?src-supplier=Verical; ComponentLink1Description: https://datasheet.ciiva.com/26861/getdatasheetpartid-417133-26861485.pdf?src-supplier=Verical; ComponentLink2URL: https://datasheet.ciiva.com/6367/ao4485-6367585.pdf?src-supplier=Digikey; ComponentLink2Description: https://datasheet.ciiva.com/6367/ao4485-6367585.pdf?src-supplier=Digikey
Q6-Q8 = MMBT2222ATT3G: Small Signal Bipolar Transistor, 0.6A I(C), 40V V(BR)CEO, 1-Element, NPN, Silicon; Manufacturer: ON Semiconductor; Supplier: Digikey; Supplier Part Number: MMBT2222ATT3GOSCT-ND; Manufacturer Part Number: MMBT2222ATT3G; RoHS: Yes; Category: BJTs; Stock: 7029; Pricing: 1=0.12, 10=0.082, 100=0.0441, 500=0.03466, 1000=0.02407, 2000=0.01994, 5000=0.01885 (USD); ComponentLink1URL: https://datasheet.ciiva.com/980/mmbt2222lt1-d-980718.pdf?src-supplier=Digikey; ComponentLink1Description: https://datasheet.ciiva.com/980/mmbt2222lt1-d-980718.pdf?src-supplier=Digikey; ComponentLink2URL: https://datasheet.ciiva.com/4724/mmbt2222att1-d-81771-4724629.pdf?src-supplier=Mouser; ComponentLink2Description: https://datasheet.ciiva.com/4724/mmbt2222att1-d-81771-4724629.pdf?src-supplier=Mouser
R38 R41 R46 R51 R56 R59 R60 R100 = RK73G1JTTD1002F: RES 10K OHM 1% 1/10W 0603; Item Type: Resistor; Value: 10kR; Power Rating: 100mW; Voltage Rating: 75V; Temperature Coefficient: 50ppm/°C; LCSC Part Number: C362180; ComponentLink1Description: LCSC; Supplier: Digi-Key; Supplier Part Number: 2019-RK73G1JTTD1002FCT-ND; RoHS: Yes; Category: Chip SMD Resistors; Stock: 249394; Pricing: 1=0.22, 10=0.118, 50=0.0812, 100=0.0699, 500=0.0513, 1000=0.04545 (USD); Case/Package: 0603; Case Code (Imperial): 0603; Case Code (Metric): 1608; Min Operating Temperature: -55°C; Max Operating Temperature: 125°C; Tolerance: 1%; Packaging: Tape and Reel; Termination: SMD/SMT; Series: RK73G; Construction: Rectangular; Length: 1.6mm; Depth: 0.8mm; Military Standard: Not; RoHS Compliant: Yes; ComponentLink2URL: http://www.mouser.com/ds/2/219/RK73G-9863.pdf?src-supplier=Mouser; ComponentLink2Description: http://www.mouser.com/ds/2/219/RK73G-9863.pdf?src-supplier=Mouser
R39 R45 R58 = RC0603FR-071KL: RES SMD 1K OHM 1% 1/10W 0603; Manufacturer: Yageo; Resistance: 1kR; Temperature Coefficient: 100ppm/°C; Power Rating: 100mW; Voltage Rating: 50V; Item type: Resistor; ComponentLink1URL: https://www.verical.com/server-webapp/html/getDatasheet?partID=409289&src-supplier=Verical; ComponentLink1Description: https://www.verical.com/server-webapp/html/getDatasheet?partID=409289&src-supplier=Verical; Supplier 1: Digi-Key; Manufacturer Part Number: RC0603FR-071KL; Stock 1: 21472395; Pricing 1: 1=0.1, 10=0.023, 100=0.0094, 1000=0.0042, 2500=0.0037 (USD); Case/Package: 0603; Contact Plating: Tin,Matte; Case Code (Imperial): 0603; Case Code (Metric): 1608; Min Operating Temperature: -55°C; Max Operating Temperature: 155°C; Tolerance: 1%; Composition: Thick Film; Packaging: Tape and Reel; Termination: SMD/SMT; Military Standard: Not; Length: 1.6mm; Height: 0.45mm; Depth: 0.8mm; Radiation Hardening: No; REACH SVHC: No SVHC; Lead Free: Lead Free; ComponentLink2URL: http://documents.rs-components.com/techlib://itc_doclist_GB.htm?stockno=5048928&src-supplier=RSComponents; ComponentLink2Description: http://documents.rs-components.com/techlib://itc_doclist_GB.htm?stockno=5048928&src-supplier=RSComponents; ComponentLink3URL: http://www.yageo.com/documents/recent/PYu-RC0603_51_RoHS_L_4.pdf?src-supplier=Avnet+Europe; ComponentLink3Description: http://www.yageo.com/documents/recent/PYu-RC0603_51_RoHS_L_4.pdf?src-supplier=Avnet+Europe; ComponentLink4URL: http://www.farnell.com/datasheets/2167052.pdf?src-supplier=Element14; ComponentLink4Description: http://www.farnell.com/datasheets/2167052.pdf?src-supplier=Element14; ComponentLink5URL: http://www.farnell.com/datasheets/1868787.pdf?src-supplier=Element14; ComponentLink5Description: http://www.farnell.com/datasheets/1868787.pdf?src-supplier=Element14; ComponentLink6URL: http://www.yageo.com/documents/recent/PYu-RC_Group_51_RoHS_L_2.pdf?src-supplier=Avnet; ComponentLink6Description: http://www.yageo.com/documents/recent/PYu-RC_Group_51_RoHS_L_2.pdf?src-supplier=Avnet; ComponentLink7URL: https://www.verical.com/server-webapp/html/getDatasheet?partID=404327&src-supplier=Verical; ComponentLink7Description: https://www.verical.com/server-webapp/html/getDatasheet?partID=404327&src-supplier=Verical; ComponentLink8URL: http://www.farnell.com/datasheets/443971.pdf?src-supplier=Element14; ComponentLink8Description: http://www.farnell.com/datasheets/443971.pdf?src-supplier=Element14; Supplier Part Number 1: 311-1.00KHRDKR-ND; LCSC Part Number: C22548
R40 = HCJ0805ZT0R00: HCJ Series 0805 Jumper Surface Mount Chip Resistor; Manufacturer: Stackpole Electronics; Power Rating: 500mW; Supplier: Digikey; Supplier Part Number: HCJ0805ZT0R00CT-ND; Manufacturer Part Number: HCJ0805ZT0R00; RoHS: Yes; Category: Chip SMD Resistors; Stock: 154858; Pricing: 1=0.55, 10=0.397, 25=0.318, 50=0.2364, 100=0.1666, 250=0.14848, 500=0.12726, 1000=0.09696 (USD); Mounting Technology: Surface Mount; Case/Package: 0805; Case Code (Metric): 2012; Case Code (Imperial): 0805; Min Operating Temperature: -55°C; Max Operating Temperature: 155°C; Value: 0R; Packaging: Cut Tape; Package Quantity: 1; Number of Terminations: 2; Series: HCJ; Length: 0.079inch; Width: 0.049inch; Height: 0.026inch; Radiation Hardening: No; Lead Free: Lead Free; RoHS Compliant: Yes; ComponentLink1URL: http://www.seielect.com/Catalog/SEI-HCJ.pdf?src-supplier=Avnet; ComponentLink1Description: http://www.seielect.com/Catalog/SEI-HCJ.pdf?src-supplier=Avnet; ComponentLink2URL: https://www.seielect.com/catalog/SEI-Packaging.pdf?src-supplier=Digikey; ComponentLink2Description: https://www.seielect.com/catalog/SEI-Packaging.pdf?src-supplier=Digikey
R42 = 1206W4F4641T5E: 250mW Thick Film Resistors 200V ±100ppm/℃ ±1% 4.64kΩ 1206 Chip Resistor - Surface Mount ROHS; Manufacturer: UNI-ROYAL; Manufacturer Part Number: 1206W4F4641T5E; Footprint: 1206; ComponentLink1Description: JLCPCB; ComponentLink1URL: https://jlcpcb.com/kr/partdetail/244478-1206W4F4641T5E/C247270; JLC Part Number: C247270; Item Type: Resistor
R43 R50 = RTT021333FTH: 62.5mW Thick Film Resistors 50V ±100ppm/℃ ±1% 133kΩ 0402 Chip Resistor - Surface Mount ROHS; Manufacturer: RALEC; Manufacturer Part Number: RTT021333FTH; Footprint: 0402; ComponentLink1Description: JLCPCB; ComponentLink1URL: https://jlcpcb.com/kr/partdetail/Ralec-RTT021333FTH/C102801; JLCPCB Part Number: C102801; Item Type: Resistor
R44 = RC-02W7323FT: 62.5mW Thick Film Resistors ±1% ±200ppm/℃ 732kΩ 0402 Chip Resistor - Surface Mount ROHS; Manufacturer: FH (Guangdong Fenghua Advanced Tech); Manufacturer Part Number: RC-02W7323FT; Package: Res-0402; JLCPCB Part Number: C321608; Item Type: Resistor
R47 = CRCW040280K6FKED: 62.5mW Thick Film Resistors 75V ±1% ±100ppm/℃ 80.6kΩ 0402 Chip Resistor - Surface Mount ROHS; Manufacturer: Vishay Intertech; Manufacturer Part Number: CRCW040280K6FKED; Package: Res-0402; JLCPCB Part Number: C2076816; Item Type: Resistor
R48 = CR0402FF1743G: 62.5mW Thick Film Resistors 50V ±1% ±200ppm/℃ 174kΩ 0402 Chip Resistor - Surface Mount ROHS; Manufacturer: LIZ Elec; Manufacturer Part Number: CR0402FF1743G; Package: 0402; LCSC Part Number: C100271; Item Type: Resistor; ComponentLink1Description: JLCPCB; ComponentLink1URL: https://jlcpcb.com/kr/partdetail/LizElec-CR0402FF1743G/C100271
R49 = RM04FTN8662: 62.5mW Thick Film Resistors 50V ±100ppm/℃ ±1% 86.6kΩ 0402 Chip Resistor - Surface Mount ROHS; Manufacturer: TA-I Tech; Manufacturer Part no: RM04FTN8662; Value: 86.6K; Package: 0402; ComponentLink1Description: JLCPCB; ComponentLink1URL: https://jlcpcb.com/kr/partdetail/ta_iTech-RM04FTN8662/C188001
R52 R54 = RTT031151FTP: 100mW Thick Film Resistors 75V ±100ppm/℃ ±1% 1.15kΩ 0603 Chip Resistor - Surface Mount ROHS; Manufacturer: RALAC; Manufacture Part Number: RTT031151FTP; Footprint: 0402; Value: 1.15K; ComponentLink1Description: JLC; ComponentLink1URL: https://jlcpcb.com/kr/partdetail/Ralec-RTT031151FTP/C103239; JLC Part Number: C103239; Item Type: Resistor
R53 = RC0402BR-07499KL: RES 499K OHM 0.1% 1/16W 0402; Manufacturer: Yageo; Item Type: Resistor; Supplier: Arrow Electronics; Supplier Part Number: RC0402BR-07499KL; Manufacturer Part Number: RC0402BR-07499KL; RoHS: Yes; Category: Chip SMD Resistors; Stock: 5065; Pricing: 1=0.2812, 10=0.1024, 25=0.1013, 100=0.065, 250=0.0644, 500=0.0615, 1000=0.0541, 3000=0.0457 (USD); RoHS Compliant: Yes; LCSC Part Number: C851813
R55 = RC0402FR-0795K3L: RES 95.3K OHM 1% 1/16W 0402; Manufacturer: Yageo; Resistance: 95.3kR; Temperature Coefficient: 100ppm/°C; Power Rating: 62.5mW; Voltage Rating: 50V; Max Power Dissipation: 63mW; Item Type: Resistor; Supplier 1: Future Electronics; Manufacturer Part Number: RC0402FR-0795K3L; RoHS: Yes; Category: Chip SMD Resistors; Stock 1: 20000; Pricing 1: 10000=0.00090, 50000=0.00080, 300000=0.00080, 1000000=0.00070, 3000000=0.00070 (USD); Case/Package: 0402; Contact Plating: Tin,Matte; Case Code (Imperial): 0402; Case Code (Metric): 1005; Size Code: 0402; Min Operating Temperature: -55°C; Max Operating Temperature: 155°C; Tolerance: 1%; Resistor Type: Thick Film; Packaging: Tape and Reel; Package Quantity: 1; Termination: SMD/SMT; Number of Terminations: 2; Voltage Rating (DC): 50V; Features: Moisture Resistant; Series: RC; Resistance Tolerance: 1%; Construction: Rectangular; Length: 0.039inch; Width: 0.02inch; Height: 0.016inch; Depth: 0.5mm; Military Standard: Not; Lead Free: Lead Free; RoHS Compliant: Yes; ComponentLink1URL: https://datasheet.ciiva.com/2453/pyu-r-int-thick-7-2453485.pdf?src-supplier=Digi-Key; ComponentLink1Description: https://datasheet.ciiva.com/2453/pyu-r-int-thick-7-2453485.pdf?src-supplier=Digi-Key; ComponentLink2URL: https://datasheet.ciiva.com/2453/pyu-r-int-thick-7-2453486.pdf?src-supplier=Digi-Key; ComponentLink2Description: https://datasheet.ciiva.com/2453/pyu-r-int-thick-7-2453486.pdf?src-supplier=Digi-Key; ComponentLink3URL: https://datasheet.ciiva.com/2453/pyu-r-int-thick-7-2453484.pdf?src-supplier=Digi-Key; ComponentLink3Description: https://datasheet.ciiva.com/2453/pyu-r-int-thick-7-2453484.pdf?src-supplier=Digi-Key; ComponentLink4URL: https://datasheet.ciiva.com/16746/pyu-rc0402-51-rohs-l-6-r-16746015.pdf?src-supplier=Future+Electronics; ComponentLink4Description: https://datasheet.ciiva.com/16746/pyu-rc0402-51-rohs-l-6-r-16746015.pdf?src-supplier=Future+Electronics; Supplier Part Number 1: 8486029; LCSC Part Number: C276280
R57 = RC0402FR-0795K3L
U11 = TPS611781RNWT: 20-V, 10-A fully integrated sync boost with load disconnect 13-VQFN-HR -40 to 85; Manufacturer: Texas Instruments; Supplier: Digikey; Supplier Part Number: 296-46568-1-ND; Manufacturer Part Number: TPS611781RNWT; RoHS: Yes; Category: Voltage Regulators - Switching; Stock: 351; Pricing: 1=5.66, 10=5.084, 25=4.8064, 100=4.1655 (USD); ComponentLink1URL: http://www.ti.com/lit/ds/symlink/tps61178.pdf?src-supplier=Digikey; ComponentLink1Description: http://www.ti.com/lit/ds/symlink/tps61178.pdf?src-supplier=Digikey
U12 = SI7145DP-T1-GE3: MOSFET P-CH 30V 60A PPAK SO-8; Manufacturer: Vishay Siliconix; Supplier: Mouser; LCSC Part Number: C144873; Manufacturer Part Number: SI7145DP-T1-GE3; RoHS: Yes; Item Type: MOSFET; Stock: 108048; Pricing: 1=1.84, 10=1.58, 50=1.58, 100=1.32, 1000=1.04, 10000=0.956 (USD); ComponentLink1URL: https://datasheet.ciiva.com/4441/si7145dp-223652-4441979.pdf?src-supplier=Mouser; ComponentLink1Description: https://datasheet.ciiva.com/4441/si7145dp-223652-4441979.pdf?src-supplier=Mouser; ComponentLink2URL: https://datasheet.ciiva.com/6367/si7145dp-6367329.pdf?src-supplier=Digikey; ComponentLink2Description: https://datasheet.ciiva.com/6367/si7145dp-6367329.pdf?src-supplier=Digikey; ComponentLink3URL: https://datasheet.ciiva.com/28599/1913296-28599670.pdf?src-supplier=Element14; ComponentLink3Description: https://datasheet.ciiva.com/28599/1913296-28599670.pdf?src-supplier=Element14; ComponentLink4URL: https://datasheet.ciiva.com/22671/1913296-22671737.pdf?src-supplier=Element14; ComponentLink4Description: https://datasheet.ciiva.com/22671/1913296-22671737.pdf?src-supplier=Element14
U13 = LD2981CM50TR: LD2981 Series 100 mA 5 V Fixed Output LDO Regulator with Inhibit - SOT-23-5; Manufacturer: STMicroelectronics; Item Type: IC; Manufacturer Part Number: LD2981CM50TR; JLC Part Number: C157380; ComponentLink1Description: JLCPCB; ComponentLink1URL: https://jlcpcb.com/kr/partdetail/Stmicroelectronics-LD2981CM50TR/C157380; Supplier: Digikey; Supplier Part Number: 497-7787-1-ND; RoHS: Yes; Category: Voltage Regulators - Linear; Stock: 17151; Pricing: 1=0.93, 10=0.83, 25=0.788, 100=0.6474, 250=0.60512, 500=0.53476, 1000=0.42219 (USD); ComponentLink2URL: https://datasheet.ciiva.com/2043/cd00001635-2043543.pdf?src-supplier=Digikey; ComponentLink2Description: https://datasheet.ciiva.com/2043/cd00001635-2043543.pdf?src-supplier=Digikey; ComponentLink3URL: https://datasheet.ciiva.com/2043/cd00001635-2043544.pdf?src-supplier=Digikey; ComponentLink3Description: https://datasheet.ciiva.com/2043/cd00001635-2043544.pdf?src-supplier=Digikey; ComponentLink4URL: https://datasheet.ciiva.com/2043/cd00001635-2043545.pdf?src-supplier=Digikey; ComponentLink4Description: https://datasheet.ciiva.com/2043/cd00001635-2043545.pdf?src-supplier=Digikey; ComponentLink5URL: https://datasheet.ciiva.com/16443/cd00001635-16443657.pdf?src-supplier=Future+Electronics; ComponentLink5Description: https://datasheet.ciiva.com/16443/cd00001635-16443657.pdf?src-supplier=Future+Electronics
U14 = ISL85005AFRZ-T7A: IC REG BUCK ADJ 5A 12DFN; Manufacturer: Renesas Electronics Corporation; Manufacturer Part Number: ISL85005AFRZ-T7A; Package: 12-DFN (4x3); LCSC Part Number: -; Item Type: IC; ComponentLink1Description: LCSC; ComponentLink1URL: *